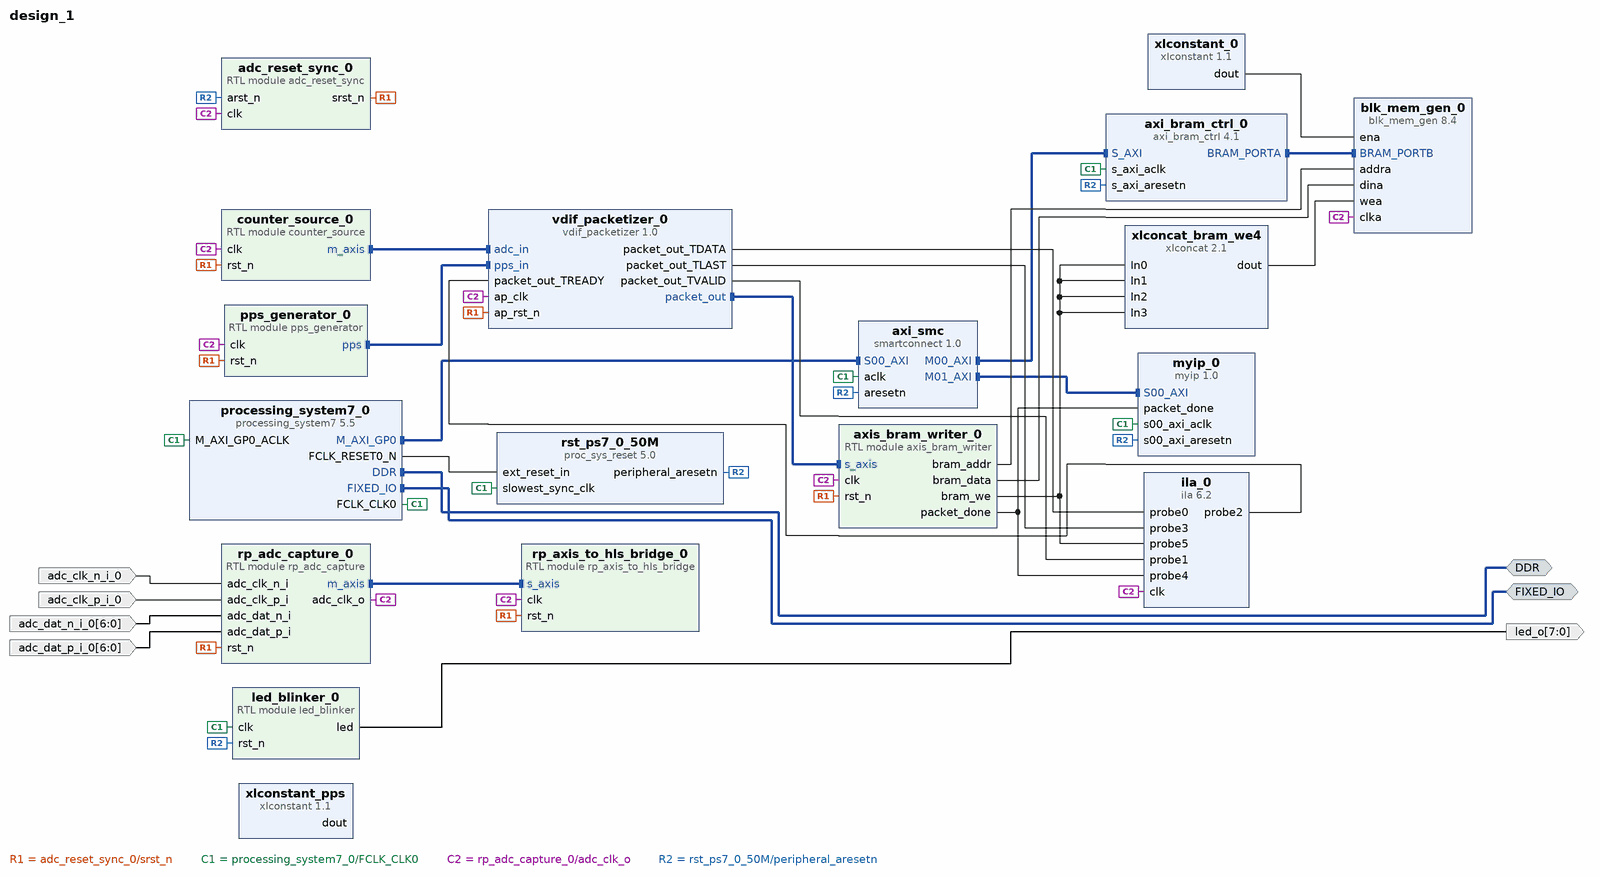
[diagram p0: block diagram of the top level]
# Vivado block design design_1, xc7z020clg400-1, Vivado 2025.2
create_bd_design design_1

create_bd_intf_port -mode Master -vlnv xilinx.com:interface:ddrx_rtl:1.0 DDR
create_bd_intf_port -mode Master -vlnv xilinx.com:display_processing_system7:fixedio_rtl:1.0 FIXED_IO
create_bd_port -dir O -from 7 -to 0 led_o
create_bd_port -dir I -from 6 -to 0 adc_dat_p_i_0
create_bd_port -dir I -from 6 -to 0 adc_dat_n_i_0
create_bd_port -dir I adc_clk_p_i_0
create_bd_port -dir I adc_clk_n_i_0

create_bd_cell -type module -reference axis_bram_writer axis_bram_writer_0
create_bd_cell -type ip -vlnv xilinx.com:ip:blk_mem_gen:8.4 blk_mem_gen_0
set_property -dict [list \
  CONFIG.Memory_Type True_Dual_Port_RAM \
  CONFIG.Port_B_Write_Rate 0 \
  CONFIG.Read_Width_B 32 \
  CONFIG.Register_PortB_Output_of_Memory_Primitives false \
  CONFIG.Use_RSTA_Pin false \
  CONFIG.Use_RSTB_Pin false \
  CONFIG.Write_Width_B 32 \
  CONFIG.use_bram_block BRAM_Controller \
] [get_bd_cells blk_mem_gen_0]
create_bd_cell -type ip -vlnv xilinx.com:ip:xlconstant:1.1 xlconstant_0
create_bd_cell -type ip -vlnv xilinx.com:ip:axi_bram_ctrl:4.1 axi_bram_ctrl_0
set_property -dict {CONFIG.SINGLE_PORT_BRAM 1} [get_bd_cells axi_bram_ctrl_0]
create_bd_cell -type ip -vlnv xilinx.com:ip:processing_system7:5.5 processing_system7_0
# 1 more settings of processing_system7_0 are not shown: defaults, MIO pin electricals, DDR timing, and values the tool derives
create_bd_cell -type ip -vlnv xilinx.com:ip:smartconnect:1.0 axi_smc
set_property -dict {CONFIG.NUM_MI 2 CONFIG.NUM_SI 1} [get_bd_cells axi_smc]
create_bd_cell -type ip -vlnv xilinx.com:ip:proc_sys_reset:5.0 rst_ps7_0_50M
create_bd_cell -type module -reference pps_generator pps_generator_0
set_property -dict {CONFIG.CLK_FREQ_HZ 125000000 CONFIG.PPS_TDATA_VALUE {"00000001"}} [get_bd_cells pps_generator_0]
create_bd_cell -type ip -vlnv xilinx.com:user:myip:1.0 myip_0
create_bd_cell -type module -reference led_blinker led_blinker_0
create_bd_cell -type module -reference rp_adc_capture rp_adc_capture_0
create_bd_cell -type module -reference adc_reset_sync adc_reset_sync_0
create_bd_cell -type module -reference counter_source counter_source_0
create_bd_cell -type ip -vlnv xilinx.com:hls:vdif_packetizer:1.0 vdif_packetizer_0
create_bd_cell -type ip -vlnv xilinx.com:ip:xlconstant:1.1 xlconstant_pps
set_property -dict {CONFIG.CONST_VAL 0 CONFIG.CONST_WIDTH 1} [get_bd_cells xlconstant_pps]
create_bd_cell -type module -reference rp_axis_to_hls_bridge rp_axis_to_hls_bridge_0
create_bd_cell -type ip -vlnv xilinx.com:ip:xlconcat:2.1 xlconcat_bram_we4
set_property -dict [list \
  CONFIG.IN0_WIDTH 1 \
  CONFIG.IN1_WIDTH 1 \
  CONFIG.IN2_WIDTH 1 \
  CONFIG.IN3_WIDTH 1 \
  CONFIG.NUM_PORTS 4 \
] [get_bd_cells xlconcat_bram_we4]
create_bd_cell -type ip -vlnv xilinx.com:ip:ila:6.2 ila_0
set_property -dict {CONFIG.C_MONITOR_TYPE Native CONFIG.C_NUM_OF_PROBES 6 CONFIG.C_PROBE0_WIDTH 32} [get_bd_cells ila_0]

# ---- connections ----

connect_bd_intf_net [get_bd_intf_pins axi_bram_ctrl_0/BRAM_PORTA] [get_bd_intf_pins blk_mem_gen_0/BRAM_PORTB]
connect_bd_intf_net [get_bd_intf_pins axi_smc/M00_AXI] [get_bd_intf_pins axi_bram_ctrl_0/S_AXI]
connect_bd_intf_net [get_bd_intf_pins axi_smc/M01_AXI] [get_bd_intf_pins myip_0/S00_AXI]
connect_bd_intf_net [get_bd_intf_pins counter_source_0/m_axis] [get_bd_intf_pins vdif_packetizer_0/adc_in]
connect_bd_intf_net [get_bd_intf_pins pps_generator_0/pps] [get_bd_intf_pins vdif_packetizer_0/pps_in]
connect_bd_intf_net [get_bd_intf_ports DDR] [get_bd_intf_pins processing_system7_0/DDR]
connect_bd_intf_net [get_bd_intf_ports FIXED_IO] [get_bd_intf_pins processing_system7_0/FIXED_IO]
connect_bd_intf_net [get_bd_intf_pins processing_system7_0/M_AXI_GP0] [get_bd_intf_pins axi_smc/S00_AXI]
connect_bd_intf_net [get_bd_intf_pins rp_adc_capture_0/m_axis] [get_bd_intf_pins rp_axis_to_hls_bridge_0/s_axis]
connect_bd_intf_net [get_bd_intf_pins vdif_packetizer_0/packet_out] [get_bd_intf_pins axis_bram_writer_0/s_axis]
connect_bd_net [get_bd_pins ila_0/probe2] [get_bd_pins vdif_packetizer_0/packet_out_TREADY]
connect_bd_net -net adc_clk_n_i_0_1 [get_bd_ports adc_clk_n_i_0] [get_bd_pins rp_adc_capture_0/adc_clk_n_i]
connect_bd_net -net adc_clk_p_i_0_1 [get_bd_ports adc_clk_p_i_0] [get_bd_pins rp_adc_capture_0/adc_clk_p_i]
connect_bd_net -net adc_dat_n_i_0_1 [get_bd_ports adc_dat_n_i_0] [get_bd_pins rp_adc_capture_0/adc_dat_n_i]
connect_bd_net -net adc_dat_p_i_0_1 [get_bd_ports adc_dat_p_i_0] [get_bd_pins rp_adc_capture_0/adc_dat_p_i]
connect_bd_net [get_bd_pins adc_reset_sync_0/srst_n] \
  [get_bd_pins pps_generator_0/rst_n] [get_bd_pins rp_adc_capture_0/rst_n] [get_bd_pins rp_axis_to_hls_bridge_0/rst_n] \
  [get_bd_pins counter_source_0/rst_n] [get_bd_pins axis_bram_writer_0/rst_n] [get_bd_pins vdif_packetizer_0/ap_rst_n]
connect_bd_net [get_bd_pins axis_bram_writer_0/bram_addr] [get_bd_pins blk_mem_gen_0/addra]
connect_bd_net [get_bd_pins axis_bram_writer_0/bram_data] [get_bd_pins blk_mem_gen_0/dina]
connect_bd_net [get_bd_pins axis_bram_writer_0/bram_we] \
  [get_bd_pins xlconcat_bram_we4/In0] [get_bd_pins xlconcat_bram_we4/In1] [get_bd_pins xlconcat_bram_we4/In2] \
  [get_bd_pins xlconcat_bram_we4/In3] [get_bd_pins ila_0/probe5]
connect_bd_net [get_bd_pins axis_bram_writer_0/packet_done] [get_bd_pins myip_0/packet_done] [get_bd_pins ila_0/probe4]
connect_bd_net [get_bd_pins led_blinker_0/led] [get_bd_ports led_o]
connect_bd_net [get_bd_pins processing_system7_0/FCLK_CLK0] \
  [get_bd_pins processing_system7_0/M_AXI_GP0_ACLK] [get_bd_pins axi_smc/aclk] [get_bd_pins axi_bram_ctrl_0/s_axi_aclk] \
  [get_bd_pins rst_ps7_0_50M/slowest_sync_clk] [get_bd_pins led_blinker_0/clk] [get_bd_pins myip_0/s00_axi_aclk]
connect_bd_net [get_bd_pins processing_system7_0/FCLK_RESET0_N] [get_bd_pins rst_ps7_0_50M/ext_reset_in]
connect_bd_net [get_bd_pins rp_adc_capture_0/adc_clk_o] \
  [get_bd_pins pps_generator_0/clk] [get_bd_pins blk_mem_gen_0/clka] [get_bd_pins adc_reset_sync_0/clk] \
  [get_bd_pins rp_axis_to_hls_bridge_0/clk] [get_bd_pins counter_source_0/clk] [get_bd_pins axis_bram_writer_0/clk] \
  [get_bd_pins vdif_packetizer_0/ap_clk] [get_bd_pins ila_0/clk]
connect_bd_net [get_bd_pins rst_ps7_0_50M/peripheral_aresetn] \
  [get_bd_pins axi_bram_ctrl_0/s_axi_aresetn] [get_bd_pins axi_smc/aresetn] [get_bd_pins led_blinker_0/rst_n] \
  [get_bd_pins adc_reset_sync_0/arst_n] [get_bd_pins myip_0/s00_axi_aresetn]
connect_bd_net [get_bd_pins vdif_packetizer_0/packet_out_TDATA] [get_bd_pins ila_0/probe0]
connect_bd_net [get_bd_pins vdif_packetizer_0/packet_out_TLAST] [get_bd_pins ila_0/probe3]
connect_bd_net [get_bd_pins vdif_packetizer_0/packet_out_TVALID] [get_bd_pins ila_0/probe1]
connect_bd_net [get_bd_pins xlconcat_bram_we4/dout] [get_bd_pins blk_mem_gen_0/wea]
connect_bd_net [get_bd_pins xlconstant_0/dout] [get_bd_pins blk_mem_gen_0/ena]
# net xlconstant_pps_dout has one end: xlconstant_pps/dout
set_property HDL_ATTRIBUTE.BMM_INFO_ADDRESS_SPACE {byte  0x40000000 32 > design_1 blk_mem_gen_0} [get_bd_cells axi_bram_ctrl_0]
set_property HDL_ATTRIBUTE.KEEP_HIERARCHY yes [get_bd_cells axi_bram_ctrl_0]
set_property HDL_ATTRIBUTE.BMM_INFO_PROCESSOR {arm > design_1 axi_bram_ctrl_0} [get_bd_cells processing_system7_0]
set_property HDL_ATTRIBUTE.KEEP_HIERARCHY yes [get_bd_cells processing_system7_0]

# ---- address map ----
assign_bd_address -offset 0x40000000 -range 8K -target_address_space [get_bd_addr_spaces processing_system7_0/Data] [get_bd_addr_segs axi_bram_ctrl_0/S_AXI/Mem0]
assign_bd_address -offset 0x44A00000 -range 64K -target_address_space [get_bd_addr_spaces processing_system7_0/Data] [get_bd_addr_segs myip_0/S00_AXI/S00_AXI_reg]

validate_bd_design
save_bd_design
